# Altium schematic sheet STM32C011F4U6TR.SchDoc
size A; SheetNumber: 3; SheetTotal: 7
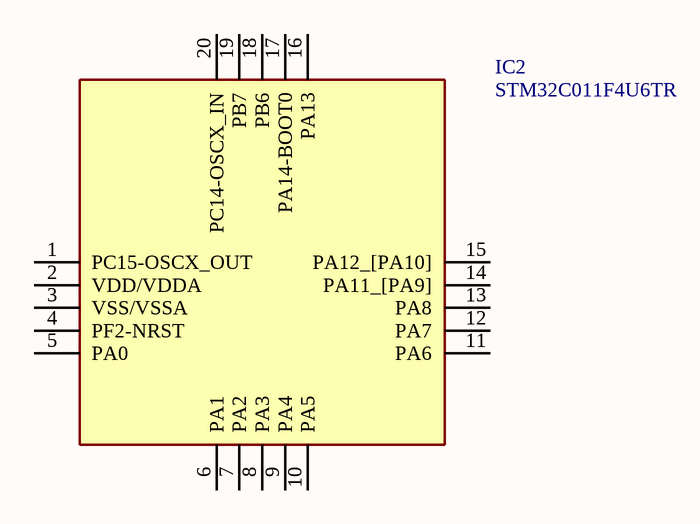
[diagram p0: STM32C011F4U6TR.SchDoc]

## Parts
IC2  STM32C011F4U6TR  [QFN50P300X300X60-20N-D]

## Nets

Not connected (* = marked no-connect by the designer): IC2 1(PC15-OSCX_OUT) 2(VDD/VDDA) 3(VSS/VSSA) 4(PF2-NRST) 5(PA0) 6(PA1) 7(PA2) 8(PA3) 9(PA4) 10(PA5) 11(PA6) 12(PA7) 13(PA8) 14(PA11_[PA9]) 15(PA12_[PA10]) 16(PA13) 17(PA14-BOOT0) 18(PB6) 19(PB7) 20(PC14-OSCX_IN)

## Library data of the parts
IC2 = STM32C011F4U6TR: Integrated Circuit; Manufacturer_Name: STMicroelectronics; Datasheet Link: https://www.st.com/resource/en/datasheet/stm32c011d6.pdf; Height: 0.6mm; Manufacturer_Part_Number: STM32C011F4U6TR; Mouser Part Number: 511-STM32C011F4U6TR; Mouser Price/Stock: https://www.mouser.co.uk/ProductDetail/STMicroelectronics/STM32C011F4U6TR?qs=IPgv5n7u5Qao9K%252BX0pScKA%3D%3D